# Altium project PCB_Project2.PrjPCB (part 2 of 2)

## Sheet Sheet5.SchDoc
size A2
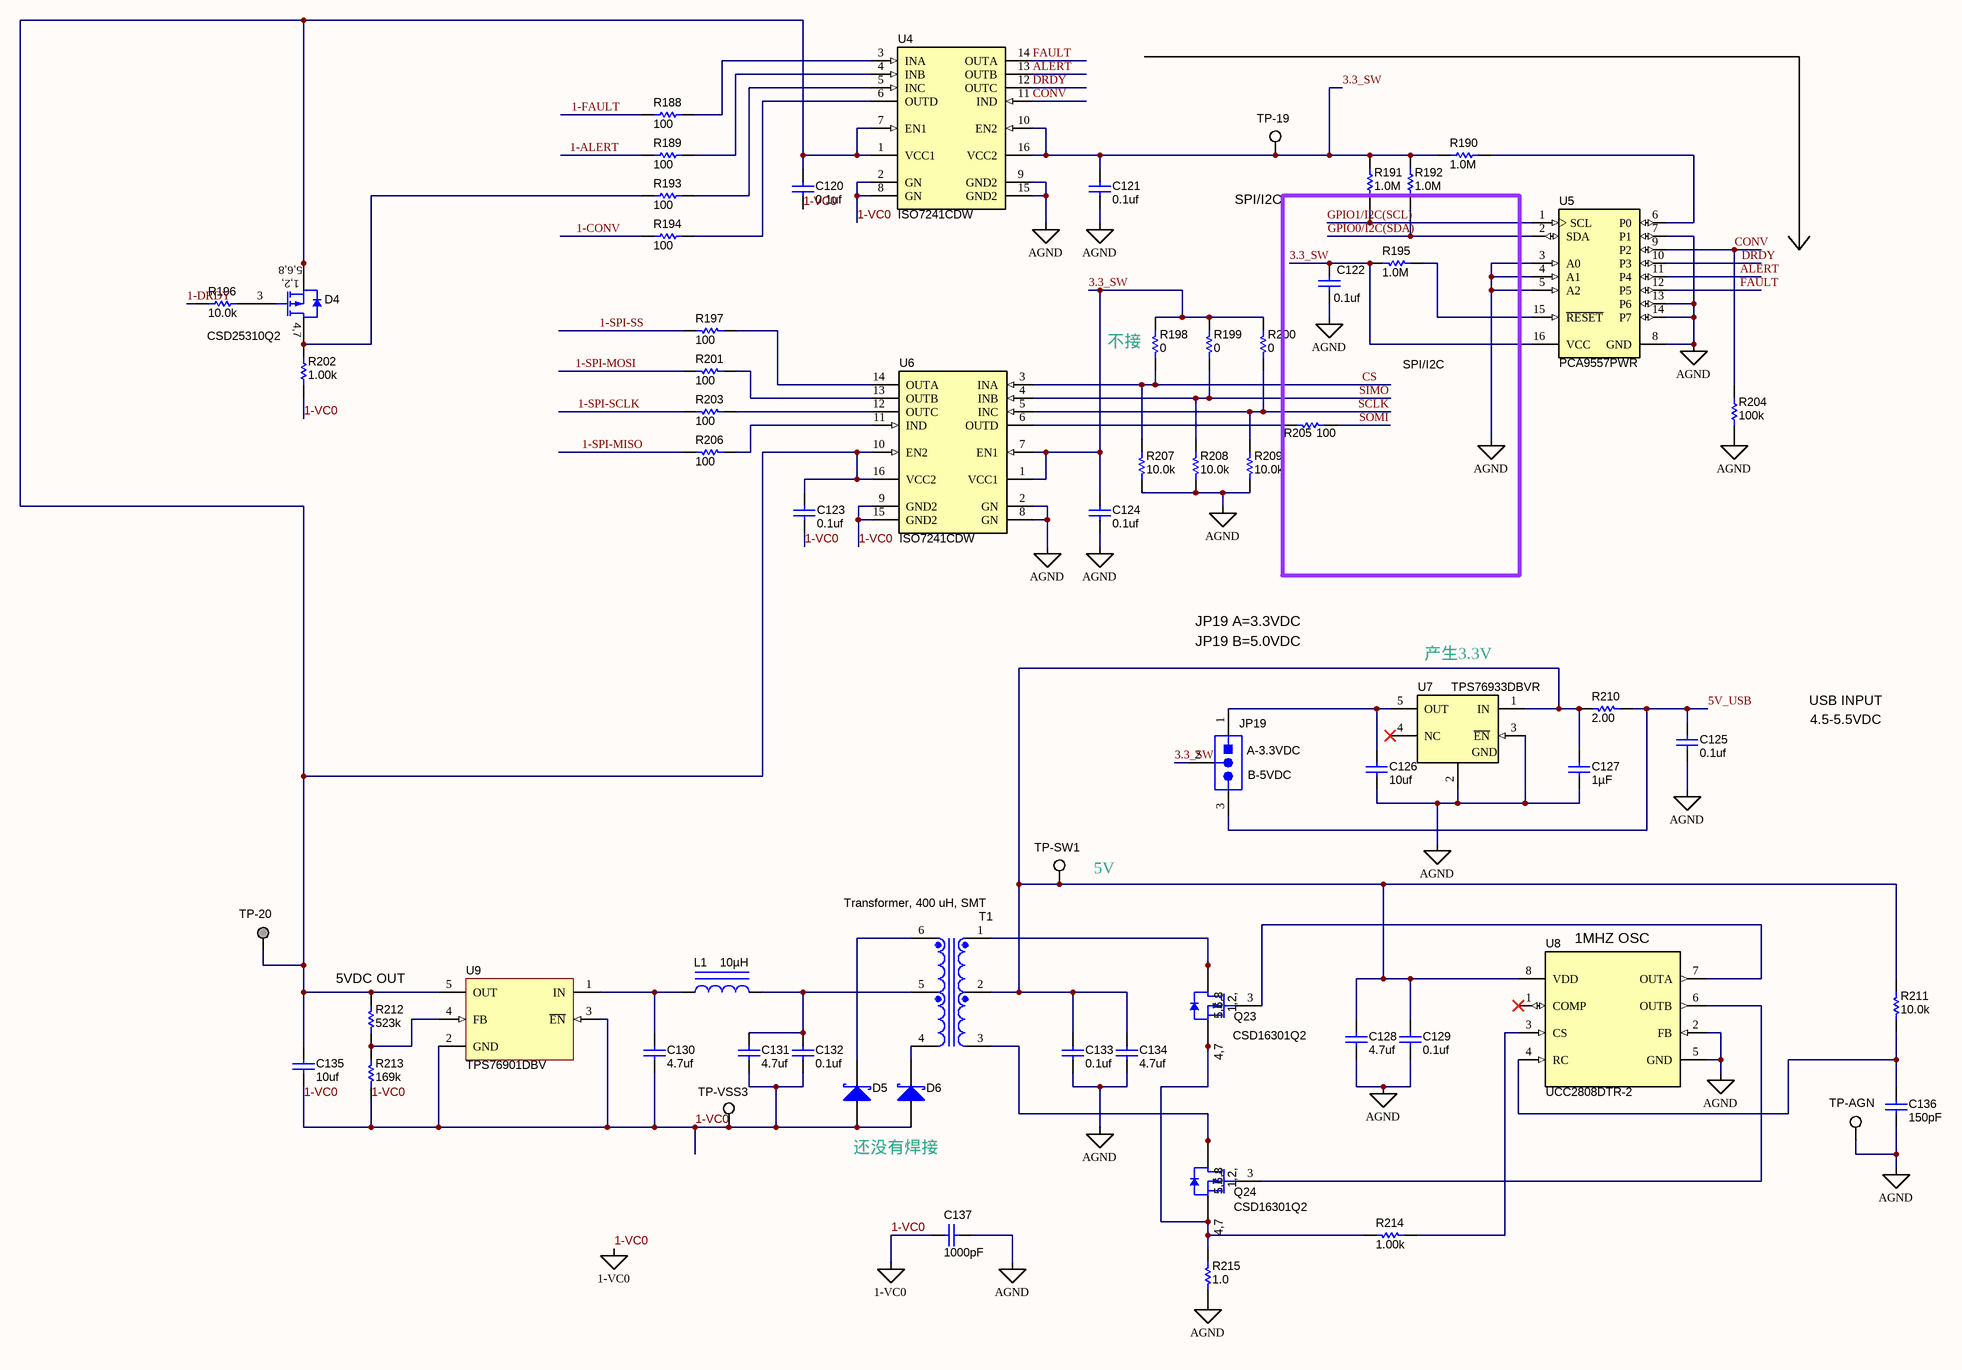
[diagram p2: Sheet5.SchDoc]

### Parts
C120  ValueDisplayed: 0.1uf  [0603]  (hidden comment: 06035C104KAT2A)
C121  ValueDisplayed: 0.1uf  [0603]  (hidden comment: 06035C104KAT2A)
C122  ValueDisplayed: 0.1uf  [0603]  (hidden comment: 06035C104KAT2A)
C123  ValueDisplayed: 0.1uf  [0603]  (hidden comment: 06035C104KAT2A)
C124  ValueDisplayed: 0.1uf  [0603]  (hidden comment: 06035C104KAT2A)
C125  ValueDisplayed: 0.1uf  [0603]  (hidden comment: 06035C104KAT2A)
C126  ValueDisplayed: 10uf  [0805_145]  (hidden comment: C2012X7R1A106M125AC)
C127  ValueDisplayed: 1µF  [0603]  (hidden comment: C1608X7R1C105K)
C128  ValueDisplayed: 4.7uf  [0603]  (hidden comment: C0603C475K8PACTU)
C129  ValueDisplayed: 0.1uf  [0603]  (hidden comment: 06035C104KAT2A)
C130  ValueDisplayed: 4.7uf  [0603]  (hidden comment: C0603C475K8PACTU)
C131  ValueDisplayed: 4.7uf  [0603]  (hidden comment: C0603C475K8PACTU)
C132  ValueDisplayed: 0.1uf  [0603]  (hidden comment: 06035C104KAT2A)
C133  ValueDisplayed: 0.1uf  [0603]  (hidden comment: 06035C104KAT2A)
C134  ValueDisplayed: 4.7uf  [0603]  (hidden comment: C0603C475K8PACTU)
C135  ValueDisplayed: 10uf  [0805_145]  (hidden comment: C2012X7R1A106M125AC)
C136  ValueDisplayed: 150pF  [0603]  (hidden comment: C0603C151J5GACTU)
C137  ValueDisplayed: 1000pF  [CAPRD750W60D700H1000]  (hidden comment: DEBE33F102ZC3B)
D4  CSD25310Q2  [TRANS_NexFET_Q2]
D5  BAT54HT1G  [sod-323]  (value not drawn)
D6  BAT54HT1G  [sod-323]  (value not drawn)
JP19  PEC03SAAN  [CONN_PEC03SAAN]  (value not drawn)
L1  ValueDisplayed: 10µH  [0805_HV]  (hidden comment: LB2012T100KR)
Q23  CSD16301Q2  [TRANS_NexFET_Q2]
Q24  CSD16301Q2  [TRANS_NexFET_Q2]
R188  ValueDisplayed: 100  [0603]  (hidden comment: CRCW0603100RJNEA)
R189  ValueDisplayed: 100  [0603]  (hidden comment: CRCW0603100RJNEA)
R190  ValueDisplayed: 1.0M  [0603]  (hidden comment: CRCW06031M00JNEA)
R191  ValueDisplayed: 1.0M  [0603]  (hidden comment: CRCW06031M00JNEA)
R192  ValueDisplayed: 1.0M  [0603]  (hidden comment: CRCW06031M00JNEA)
R193  ValueDisplayed: 100  [0603]  (hidden comment: CRCW0603100RJNEA)
R194  ValueDisplayed: 100  [0603]  (hidden comment: CRCW0603100RJNEA)
R195  ValueDisplayed: 1.0M  [0603]  (hidden comment: CRCW06031M00JNEA)
R196  ValueDisplayed: 10.0k  [0603]  (hidden comment: ERJ-3EKF1002V)
R197  ValueDisplayed: 100  [0603]  (hidden comment: CRCW0603100RJNEA)
R198  ValueDisplayed: 0  [0603]  (hidden comment: CRCW06030000Z0EA)
R199  ValueDisplayed: 0  [0603]  (hidden comment: CRCW06030000Z0EA)
R200  ValueDisplayed: 0  [0603]  (hidden comment: CRCW06030000Z0EA)
R201  ValueDisplayed: 100  [0603]  (hidden comment: CRCW0603100RJNEA)
R202  ValueDisplayed: 1.00k  [0603]  (hidden comment: RG1608P-102-B-T5)
R203  ValueDisplayed: 100  [0603]  (hidden comment: CRCW0603100RJNEA)
R204  ValueDisplayed: 100k  [0603]  (hidden comment: CRCW0603100KFKEA)
R205  ValueDisplayed: 100  [0603]  (hidden comment: CRCW0603100RJNEA)
R206  ValueDisplayed: 100  [0603]  (hidden comment: CRCW0603100RJNEA)
R207  ValueDisplayed: 10.0k  [0603]  (hidden comment: ERJ-3EKF1002V)
R208  ValueDisplayed: 10.0k  [0603]  (hidden comment: ERJ-3EKF1002V)
R209  ValueDisplayed: 10.0k  [0603]  (hidden comment: ERJ-3EKF1002V)
R210  ValueDisplayed: 2.00  [0603]  (hidden comment: RC0603FR-072RL)
R211  ValueDisplayed: 10.0k  [0603]  (hidden comment: ERJ-3EKF1002V)
R212  ValueDisplayed: 523k  [0603]  (hidden comment: RC0603FR-07523KL)
R213  ValueDisplayed: 169k  [0603]  (hidden comment: RC0603FR-07169KL)
R214  ValueDisplayed: 1.00k  [0603]  (hidden comment: RG1608P-102-B-T5)
R215  ValueDisplayed: 1.0  [0603]  (hidden comment: CRCW06031R00JNEA)
T1  Transformer, 400 uH, SMT  [Coilcraft_Q4470-CL]
TP-19  5015  [Testpoint_Keystone_Miniature]  (value not drawn)
TP-20  5020  [Testpoint_Keystone_Miniature]  (value not drawn)  (no BOM)
TP-AGN  5015  [Testpoint_Keystone_Miniature]  (value not drawn)
TP-SW1  5015  [Testpoint_Keystone_Miniature]  (value not drawn)
TP-VSS3  5015  [Testpoint_Keystone_Miniature]  (value not drawn)
U4  ISO7241CDW  [DW0016A_N]
U5  PCA9557PWR  [PW0016A_N]
U6  ISO7241CDW  [DW0016A_N]
U7  TPS76933DBVR  [DBV0005A_N]
U8  UCC2808DTR-2  [D0008A_N]
U9  TPS76901DBV  [DBV0005A_N]

### Blocks framed on the sheet
SPI/I2C: C122 R195 R205

### Nets
1-VC0: C120.2 C123.2 C130.2 C131.2 C132.2 C135.2 C137.2 D5.2(A) D6.2(A) R202.1 R213.1 TP-VSS3.1 U4.2(GN) U4.8(GN) U6.9(GND2) U6.15(GND2) U9.2(GND) U9.3(~{EN})  [project net 1-CELL0]
AGND: C121.2 C122.2 C124.2 C125.2 C126.2 C127.2 C128.2 C129.2 C133.2 C134.2 C136.2 C137.1 R204.1 R207.1 R208.1 R209.1 R215.1 TP-AGN.1 U4.9(GND2) U4.15(GND2) U5.3(A0) U5.4(A1) U5.5(A2) U5.7(P1) U5.8(GND) U5.13(P6) U5.14(P7) U6.2(GN) U6.8(GN) U7.2(GND) U7.3(~{EN}) U8.2(FB) U8.5(GND)
1-ALERT: R189.1
1-CONV: R194.1
1-DRDY: R196.1
1-FAULT: R188.1
1-SPI-MISO: R206.2
1-SPI-MOSI: R201.2
1-SPI-SCLK: R203.2
1-SPI-SS: R197.2
3.3_SW: C121.1 C122.1 C124.1 JP19.2 R190.2 R191.2 R192.2 R195.2 R198.2 R199.2 R200.2 TP-19.1 U4.10(EN2) U4.16(VCC2) U5.16(VCC) U6.1(VCC1) U6.7(EN1)
5V_USB: C125.1 JP19.3 R210.1
ALERT: U4.13(OUTB) U5.11(P4)
CONV: R204.2 U4.11(IND) U5.9(P2)
CS: R198.1 R207.2 U6.3(INA)
DRDY: U4.12(OUTC) U5.10(P3)
FAULT: U4.14(OUTA) U5.12(P5)
GPIO0/I2C(SDA): R192.1 U5.2(SDA)
GPIO1/I2C(SCL): R191.1 U5.1(SCL)
SCLK: R200.1 R209.2 U6.5(INC)
SIMO: R199.1 R208.2 U6.4(INB)
SOMI: R205.1
NetC120_1: C120.1 C123.1 C135.1 D4.1(S) D4.2(S) D4.5(S) D4.6(S) D4.8(S) R212.1 TP-20.1 U4.1(VCC1) U4.7(EN1) U6.10(EN2) U6.16(VCC2) U9.5(OUT)
NetC126_1: C126.1 JP19.1 U7.5(OUT)
NetC127_1: C127.1 C128.1 C129.1 C133.1 C134.1 R210.2 R211.1 T1.2 TP-SW1.1 U7.1(IN) U8.8(VDD)
NetC130_1: C130.1 L1.2 U9.1(IN)
NetC131_1: C131.1 C132.1 L1.1 T1.5
NetC136_1: C136.1 R211.2 U8.4(RC)
NetD4_3: D4.3(G) R196.2
NetD4_4: D4.4(D) D4.7(D) R193.1 R202.2
NetD5_1: D5.1(K) T1.6
NetD6_1: D6.1(K) T1.4
NetQ23_1: Q23.1(D) Q23.2(D) Q23.5(D) Q23.6(D) Q23.8(D) T1.1
NetQ23_3: Q23.3(G) U8.7(OUTA)
NetQ23_4: Q23.4(S) Q23.7(S) Q24.4(S) Q24.7(S) R214.2 R215.2
NetQ24_1: Q24.1(D) Q24.2(D) Q24.5(D) Q24.6(D) Q24.8(D) T1.3
NetQ24_3: Q24.3(G) U8.6(OUTB)
NetR188_2: R188.2 U4.3(INA)
NetR189_2: R189.2 U4.4(INB)
NetR190_1: R190.1 U5.6(P0)
NetR193_2: R193.2 U4.5(INC)
NetR194_2: R194.2 U4.6(OUTD)
NetR195_1: R195.1 U5.15(~{RESET})
NetR197_1: R197.1 U6.14(OUTA)
NetR201_1: R201.1 U6.13(OUTB)
NetR203_1: R203.1 U6.12(OUTC)
NetR205_2: R205.2 U6.6(OUTD)
NetR206_1: R206.1 U6.11(IND)
NetR212_2: R212.2 R213.2 U9.4(FB)
NetR214_1: R214.1 U8.3(CS)

Not connected (* = marked no-connect by the designer): U7 4(NC)*; U8 1(COMP)*

### Notes on the sheet
- (near TP-19) SPI/I2C
- (near R198) 不接
- JP19 A=3.3VDC
- JP19 B=5.0VDC
- (near U7) 产生3.3V
- USB INPUT
- (near JP19) B-5VDC
- (near JP19) A-3.3VDC
- 4.5-5.5VDC
- (near TP-SW1) 5V
- (near R212) 5VDC OUT
- (near U8) 1MHZ OSC
- 还没有焊接
- (in symbol CSD16301Q2) 5,6,8; 1,2,; 4,7
- (in symbol CSD25310Q2) 5,6,8; 1,2,; 4,7

### Library data of the parts
C120-C125 C129 C132 C133 = 06035C104KAT2A: CAP, CERM, 0.1uf, 50 V, +/- 10%, X7R, 0603; Manufacturer: AVX; Polarized: N; CompType: Capacitor; U/M: EA; Cap_F: 0.0000001; Tolerance_%: 10; Value1: Unknown; VDC_V: 50; Value2: 50V; TaMin_C: -55; TaMax_C: 125; SymbolVersion: 2008-07-09; Value: 0.1uF; PartNumber: 06035C104KAT2A; PackageReference: 0603; RoHS: Y; MountType: SMT; Technology: Ceramic; TempCo: X7R; Cap_Case: 0603; Published: 2008-06-19; Publisher: Texas Instruments; LatestRevisionDate: 2015-07-09; ComponentLink1Description: Datasheet link; ComponentLink1URL: http://www.avx.com/docs/Catalogs/cx7r.pdf; Supplier 1: Digi-Key; Supplier Part Number 1: 478-5052-1-ND; Supplier 2: Mouser; Supplier Part Number 2: 581-06035C104KAT2A; Supplier 3: Farnell; Supplier Part Number 3: 1301804
C126 C135 = C2012X7R1A106M125AC: CAP, CERM, 10uf, 10 V, +/- 20%, X7R, 0805; Manufacturer: TDK; Polarized: N; CompType: Capacitor; U/M: EA; Cap_F: 0.00001; Tolerance_%: 20; Value1: Unknown; VDC_V: 10; Value2: 10V; TaMin_C: -55; TaMax_C: 125; Cap_Case: 0805; SymbolVersion: 2008-07-09; Value: 10uF; PartNumber: C2012X7R1A106M125AC; PackageReference: 0805; RoHS: Y; MountType: SMT; Technology: Ceramic; TempCo: X7R; Published: 2008-06-19; Publisher: Texas Instruments; LatestRevisionDate: 2015-07-09; ComponentLink1Description: Datasheet link; ComponentLink1URL: http://product.tdk.com/capacitor/mlcc/en/documents/mlcc_commercial_general_en.pdf; Supplier 1: Digi-Key; Supplier Part Number 1: 445-7592-1-ND; Supplier 2: Mouser; Supplier Part Number 2: 810-C2012X7R1A106M; Supplier 3: Farnell; Supplier Part Number 3: 2354122
C127 = C1608X7R1C105K: CAP, CERM, 1 µF, 16 V, +/- 10%, X7R, 0603; Manufacturer: TDK; Polarized: N; CompType: Capacitor; Value: 1uF; U/M: EA; Cap_F: 0.000001; Tolerance_%: 10; ESR_ohm: 0.0057; Value1: 0.0057 ohm; VDC_V: 16; Value2: 16V; TaMin_C: -55; TaMax_C: 125; SymbolVersion: 2008-07-09; PartNumber: C1608X7R1C105K; PackageReference: 0603; RoHS: Y; MountType: SMT; Technology: Ceramic; TempCo: X7R; Cap_Case: 0603; Published: 2008-06-19; Publisher: Texas Instruments; LatestRevisionDate: 2015-07-09; ComponentLink1Description: Datasheet link; ComponentLink1URL: http://www.tdk.co.jp/tefe02/e412_c.pdf; Supplier 1: Digi-Key; Supplier Part Number 1: 445-1604-1-ND; Supplier 2: Farnell; Supplier Part Number 2: 1907343
C128 C130 C131 C134 = C0603C475K8PACTU: CAP, CERM, 4.7uf, 10 V, +/- 10%, X5R, 0603; Manufacturer: Kemet; Polarized: N; CompType: Capacitor; U/M: EA; Cap_F: 0.0000047; Tolerance_%: 10; ESR_ohm: 0.006; Value1: 0.006 ohm; Value2: 10V; IRMS_A: 7.24; TaMin_C: -55; TaMax_C: 85; SymbolVersion: 2008-07-09; Value: 4.7uF; PartNumber: C0603C475K8PACTU; PackageReference: 0603; RoHS: Y; VDC_V: 10; MountType: SMT; Technology: Ceramic; TempCo: X5R; Cap_Case: 0603; Published: 2008-06-19; Publisher: Texas Instruments; LatestRevisionDate: 2015-07-09; ComponentLink1Description: Datasheet link; ComponentLink1URL: http://www.kemet.com/kemet/web/homepage/kechome.nsf/vapubfiles/F3102_Y5V.pdf/$file/F3102_Y5V.pdf; Supplier 1: Digi-Key; Supplier Part Number 1: 399-5503-1-ND; Supplier 2: Mouser; Supplier Part Number 2: 80-C0603C475K8P; Supplier 3: Farnell; Supplier Part Number 3: 1572625
C136 = C0603C151J5GACTU: CAP, CERM, 150 pF, 50 V, +/- 5%, C0G/NP0, 0603; Manufacturer: Kemet; Polarized: N; CompType: Capacitor; Value: 150pF; U/M: EA; Cap_F: 0.00000000015; Tolerance_%: 5; Value1: Unknown; VDC_V: 50; Value2: 50V; TaMin_C: -55; TaMax_C: 125; SymbolVersion: 2008-07-09; PartNumber: C0603C151J5GACTU; PackageReference: 0603; RoHS: Y; MountType: SMT; Technology: Ceramic; TempCo: C0G/NP0; Cap_Case: 0603; Published: 2008-06-19; Publisher: Texas Instruments; LatestRevisionDate: 2015-07-09; ComponentLink1Description: Datasheet link; ComponentLink1URL: http://www.kemet.com/kemet/web/homepage/kechome.nsf/vapubfiles/F3102_Y5V.pdf/$file/F3102_Y5V.pdf; Supplier 1: Digi-Key; Supplier Part Number 1: 399-1063-1-ND; Supplier 2: Mouser; Supplier Part Number 2: 80-C0603C151J5G; Supplier 3: Farnell; Supplier Part Number 3: 1414615
C137 = DEBE33F102ZC3B: CAP, CERM, 1000 pF, 3150 V, +80/-20%, E, Radial Disc D7x6mm; Manufacturer: MuRata; Polarized: N; CompType: Capacitor; Value: 1000pF; U/M: EA; Cap_F: 0.000000001; Tolerance_%: 80; Value1: Unknown; VDC_V: 3150; Value2: 3150V; TaMin_C: -25; TaMax_C: 85; Cap_Case: Disc, 7x6mm; SymbolVersion: 2008-07-09; PartNumber: DEBE33F102ZC3B; PackageReference: Radial Disc D7x6mm; RoHS: Y; MountType: TH; Technology: Ceramic; TempCo: E; Published: 2008-06-19; Publisher: Texas Instruments; LatestRevisionDate: 2015-07-09; ComponentLink1Description: Datasheet link; ComponentLink1URL: http://www.murata.com/products/catalog/pdf/c85e.pdf; Supplier 1: Digi-Key; Supplier Part Number 1: 490-4247-ND; Supplier 2: Mouser; Supplier Part Number 2: 81-DEBE33F102ZC3B; Supplier 3: Farnell; Supplier Part Number 3: 9527192
D4 = CSD25310Q2: MOSFET, P-CH, -20 V, -20 A, SON 2x2mm; Manufacturer: Texas Instruments; Alternate Manufacturer: None; SymbolCreator: a0411947; U/M: EA; ChType: P; Value: -20V; Value1: 0.0239 ohm; Rdson45_ohm: 0.0239; Value2: 3.6 nC; QgTyp_nC: 3.6; Vgs_V: 8; AEC Category: Q101; SymbolVersion: 2013-04-04; PartNumber: CSD25310Q2; PackageReference: SON 2x2mm; CompType: MOSFET; VdsMax_V: -20; IdsMax_A: -20; RoHS: Y; MountType: SMT; Published: 2008-06-19; Publisher: Texas Instruments; LatestRevisionDate: 2015-08-18; LatestRevisionNote: Added parts.; ComponentLink1Description: Datasheet link; ComponentLink1URL: http://www.ti.com/lit/ds/symlink/csd25310q2.pdf; Supplier 1: Digi-Key; Supplier Part Number 1: CSD25310Q2-ND; Supplier 2: Mouser; Supplier Part Number 2: 595-CSD25310Q2; AEC Qualified: ?
D5 D6 = BAT54HT1G: Diode, Schottky, 30 V, 0.2 A, SOD-323; Manufacturer: ON Semiconductor; U/M: EA; Vf_V: 0.35; Value: 30V; Value1: 0.2A; Value2: 0.35V; Io_A: 0.2; Vr_V: 30; CompType: Diode; SymbolVersion: 2008-12-08; PartNumber: BAT54HT1G; PackageReference: SOD-323; MountType: SMT; Type: Schottky; Published: 2008-06-26; Publisher: Texas Instruments; LatestRevisionDate: 2015-07-08; ComponentLink1Description: Datasheet link; ComponentLink1URL: http://www.onsemi.com/pub/Collateral/BAT54HT1-D.PDF; Supplier 1: Digi-Key; Supplier Part Number 1: BAT54HT1OSCT-ND; Supplier 2: Mouser; Supplier Part Number 2: 863-BAT54HT1G; Supplier 3: Farnell; Supplier Part Number 3: 1459033
JP19 = PEC03SAAN: Header, 100mil, 3x1, Tin, TH; Manufacturer: Sullins Connector Solutions; SymbolCreator: a0799628; U/M: EA; SymbolVersion: 2013-03-28; PartNumber: PEC03SAAN; PackageReference: Header, 3 PIN, 100mil, Tin; ClassName: Header; CompType: Header; RoHS: Y; MountType: TH; ComponentLink1Description: Datasheet Link; ComponentLink1URL: http://www.sullinscorp.com/catalogs/97_Page78-79_HEADER_.100_2.54mm_MALE_BREAKAWAY.pdf; Publisher: Texas Instruments; LatestRevisionDate: 2015-07-02; Supplier 1: Digi-Key; Supplier Part Number 1: S1012E-03-ND
L1 = LB2012T100KR: Inductor, Wirewound, Ferrite, 10uH, 0.12A, 0.5 ohm, SMD; Manufacturer: Taiyo Yuden; Ind_H: 10.0E-6; Imax_A: 0.12; Irms: 0.12A @ C rise; Isat: 0.12A @ % inductance drop; DCR_ohm: 0.5; Value1: 0.5 ohm; U/M: EA; SymbolVersion: 2008-07-23; CompType: Inductor; Value: 10uH; PartNumber: LB2012T100KR; PackageReference: 0805; Value2: 0.12A; Technology: Wirewound; MountType: SMT; Material: Ferrite; Published: 2008-06-26; Publisher: Texas Instruments; LatestRevisionDate: 2013-10-24; ComponentLink1Description: Datasheet link; ComponentLink1URL: http://www.yuden.co.jp/ut/product/category/inductor/LB2012T100KR.pdf; RoHS: Y; Supplier 1: Digi-Key; Supplier Part Number 1: 587-2487-1-ND; Supplier 2: Mouser; Supplier Part Number 2: 963-LB2012T100KR; Supplier 3: Farnell; Supplier Part Number 3: 1463501
Q23 Q24 = CSD16301Q2: MOSFET, N-CH, 25 V, 5 A, SON 2x2mm; Manufacturer: Texas Instruments; Alternate Manufacturer: None; U/M: EA; ChType: N; Value: 25V; VdsMax_V: 25; Value1: 0.023 ohm; Rdson45_ohm: 0.023; Value2: 2 nC; QgTyp_nC: 2; Vgs_V: 10; IdsMax_A: 5; SymbolVersion: 2011-11-14; CompType: MOSFET; PartNumber: CSD16301Q2; PackageReference: SON 2x2mm; RoHS: Y; MountType: SMT; Published: 2008-06-19; Publisher: Texas Instruments; LatestRevisionDate: 2015-08-03; LatestRevisionNote: Added parts.; ComponentLink1Description: Datasheet link; ComponentLink1URL: http://www.ti.com/lit/ds/symlink/csd16301q2.pdf; Supplier 1: Digi-Key; Supplier Part Number 1: 296-25260-1-ND; Supplier 2: Mouser; Supplier Part Number 2: 595-CSD16301Q2; Supplier 3: Farnell; Supplier Part Number 3: 1854243
R188 R189 R193 R194 R197 R201 R203 R205 R206 = CRCW0603100RJNEA: RES, 100, 5%, 0.1 W, 0603; Manufacturer: Vishay-Dale; CompType: Resistor; Value: 100; Value_Code: 100R; Tolerance_%: 5; Power_W: 0.1; Value2: 0.1W; VDC_V: 75; TempCo: 200 ppm/C; EIA_Code: E24; U/M: EA; SymbolVersion: 2009-05-29; PartNumber: CRCW0603100RJNEA; PackageReference: 0603; RoHS: Y; Res_ohm: 100; Value1: 5%; MountType: SMT; Technology: Thick Film; Published: 2008-06-26; Publisher: Texas Instruments; LatestRevisionDate: 2015-06-13; ComponentLink1Description: Datasheet link; ComponentLink1URL: http://www.vishay.com/docs/20035/dcrcwe3.pdf; Supplier 1: Digi-Key; Supplier Part Number 1: 541-100GCT-ND; Supplier 2: Mouser; Supplier Part Number 2: 71-CRCW0603J-100-E3; Supplier 3: Farnell; Supplier Part Number 3: 1514715
R190-R192 R195 = CRCW06031M00JNEA: RES, 1.0 M, 5%, 0.1 W, 0603; Manufacturer: Vishay-Dale; CompType: Resistor; Value: 1.0Meg; Res_ohm: 1000000; Value_Code: 1M00; Tolerance_%: 5; Power_W: 0.1; Value2: 0.1W; VDC_V: 75; TempCo: 200 ppm/C; EIA_Code: E24; U/M: EA; SymbolVersion: 2009-05-29; PartNumber: CRCW06031M00JNEA; PackageReference: 0603; RoHS: Y; Value1: 5%; MountType: SMT; Technology: Thick Film; Published: 2008-06-26; Publisher: Texas Instruments; LatestRevisionDate: 2015-06-13; ComponentLink1Description: Datasheet link; ComponentLink1URL: http://www.vishay.com/docs/20035/dcrcwe3.pdf; Supplier 1: Digi-Key; Supplier Part Number 1: 541-1.0MGCT-ND; Supplier 2: Mouser; Supplier Part Number 2: 71-CRCW0603J-1.0M-E3; Supplier 3: Farnell; Supplier Part Number 3: 1514706
R196 R207-R209 R211 = ERJ-3EKF1002V: RES, 10.0 k, 1%, 0.1 W, 0603; Manufacturer: Panasonic; CompType: Resistor; Value: 10.0k; Res_ohm: 10000; Value_Code: 10k0; Tolerance_%: 1; Power_W: 0.1; Value2: 0.1W; VDC_V: 75; TempCo: 100 ppm/C; EIA_Code: E96; U/M: EA; SymbolVersion: 2009-05-29; PartNumber: ERJ-3EKF1002V; PackageReference: 0603; RoHS: Y; Value1: 1%; MountType: SMT; Technology: Thick Film; Published: 2008-06-26; Publisher: Texas Instruments; LatestRevisionDate: 2015-06-13; ComponentLink1Description: Datasheet link; ComponentLink1URL: http://industrial.panasonic.com/www-data/pdf/AOA0000/AOA0000CE2.pdf; Supplier 1: Digi-Key; Supplier Part Number 1: P10.0KHCT-ND; Supplier 2: Mouser; Supplier Part Number 2: 667-ERJ-3EKF1002V; Supplier 3: Farnell; Supplier Part Number 3: 2397737
R198-R200 = CRCW06030000Z0EA: RES, 0, 5%, 0.1 W, 0603; Manufacturer: Vishay-Dale; CompType: Resistor; Value: 0; Value_Code: 0000; Tolerance_%: 5; Power_W: 0.1; Value2: 0.1W; VDC_V: 75; TempCo: 200 ppm/C; EIA_Code: E24; U/M: EA; SymbolVersion: 2009-05-29; PartNumber: CRCW06030000Z0EA; PackageReference: 0603; RoHS: Y; Res_ohm: 0; Value1: 5%; MountType: SMT; Technology: Thick Film; Published: 2008-06-26; Publisher: Texas Instruments; LatestRevisionDate: 2015-06-13; ComponentLink1Description: Datasheet link; ComponentLink1URL: http://www.vishay.com/docs/20035/dcrcwe3.pdf; Supplier 1: Digi-Key; Supplier Part Number 1: 541-0.0GCT-ND; Supplier 2: Mouser; Supplier Part Number 2: 71-CRCW0603-0-E3; Supplier 3: Farnell; Supplier Part Number 3: 1469739
R202 R214 = RG1608P-102-B-T5: RES, 1.00 k, 0.1%, 0.1 W, 0603; Manufacturer: Susumu Co Ltd; CompType: Resistor; Value: 1.00k; Res_ohm: 1000; Value_Code: 1k00; Tolerance_%: 0.1; Value2: 0.1W; VDC_V: 75; TempCo: 25 ppm/C; EIA_Code: E192; U/M: EA; SymbolVersion: 2009-05-29; PartNumber: RG1608P-102-B-T5; PackageReference: 0603; RoHS: Y; Value1: 0.1%; Power_W: 0.1; MountType: SMT; Technology: Metal Film; Published: 2008-06-26; Publisher: Texas Instruments; LatestRevisionDate: 2015-06-13; ComponentLink1Description: Datasheet link; ComponentLink1URL: http://www.susumu.co.jp/english/pdf/products-j01-01.pdf; Supplier 1: Digi-Key; Supplier Part Number 1: RG16P1.0KBCT-ND; Supplier 2: Mouser; Supplier Part Number 2: 754-RG1608P-102-B-T5; Supplier 3: Farnell; Supplier Part Number 3: 1797076
R204 = CRCW0603100KFKEA: RES, 100 k, 1%, 0.1 W, 0603; Manufacturer: Vishay-Dale; CompType: Resistor; Value: 100k; Res_ohm: 100000; Tolerance_%: 1; Power_W: 0.1; Value2: 0.1W; VDC_V: 75; TempCo: 100 ppm/C; EIA_Code: E96; U/M: EA; SymbolVersion: 2009-05-29; PartNumber: CRCW0603100KFKEA; PackageReference: 0603; RoHS: Y; Value_Code: 100k; Value1: 1%; MountType: SMT; Technology: Thick Film; Published: 2008-06-26; Publisher: Texas Instruments; LatestRevisionDate: 2015-06-13; ComponentLink1Description: Datasheet link; ComponentLink1URL: http://www.vishay.com/docs/20035/dcrcwe3.pdf; Supplier 1: Digi-Key; Supplier Part Number 1: 541-100KHCT-ND; Supplier 2: Mouser; Supplier Part Number 2: 71-CRCW0603-100K-E3; Supplier 3: Farnell; Supplier Part Number 3: 1469649
R210 = RC0603FR-072RL: RES, 2.00, 1%, 0.1 W, 0603; Manufacturer: Yageo America; CompType: Resistor; Value: 2.00; Res_ohm: 2; Value_Code: 2R00; Tolerance_%: 1; Power_W: 0.1; Value2: 0.1W; VDC_V: 150; TempCo: 200 ppm/C; EIA_Code: E96; U/M: EA; SymbolVersion: 2009-05-29; PartNumber: RC0603FR-072RL; PackageReference: 0603; RoHS: Y; Value1: 1%; MountType: SMT; Technology: Thick Film; Published: 2008-06-26; Publisher: Texas Instruments; LatestRevisionDate: 2015-06-13; ComponentLink1Description: Datasheet link; ComponentLink1URL: http://www.yageo.com/pdf/Pu-RC0603_51_PbFree_L_2.pdf; Supplier 1: Digi-Key; Supplier Part Number 1: 311-2.00HRCT-ND; Supplier 2: Mouser; Supplier Part Number 2: 603-RC0603FR-072RL; Supplier 3: Farnell; Supplier Part Number 3: 1872498
R212 = RC0603FR-07523KL: RES, 523 k, 1%, 0.1 W, 0603; Manufacturer: Yageo America; CompType: Resistor; Value: 523k; Res_ohm: 523000; Tolerance_%: 1; Power_W: 0.1; Value2: 0.1W; VDC_V: 150; TempCo: 200 ppm/C; EIA_Code: E96; U/M: EA; SymbolVersion: 2009-05-29; PartNumber: RC0603FR-07523KL; PackageReference: 0603; RoHS: Y; Value_Code: 523k; Value1: 1%; MountType: SMT; Technology: Thick Film; Published: 2008-06-26; Publisher: Texas Instruments; LatestRevisionDate: 2015-06-13; ComponentLink1Description: Datasheet link; ComponentLink1URL: http://www.yageo.com/pdf/Pu-RC0603_51_PbFree_L_2.pdf; Supplier 1: Digi-Key; Supplier Part Number 1: 311-523KHRCT-ND; Supplier 2: Mouser; Supplier Part Number 2: 603-RC0603FR-07523KL
R213 = RC0603FR-07169KL: RES, 169 k, 1%, 0.1 W, 0603; Manufacturer: Yageo America; CompType: Resistor; Value: 169k; Res_ohm: 169000; Tolerance_%: 1; Power_W: 0.1; Value2: 0.1W; VDC_V: 150; TempCo: 200 ppm/C; EIA_Code: E96; U/M: EA; SymbolVersion: 2009-05-29; PartNumber: RC0603FR-07169KL; PackageReference: 0603; RoHS: Y; Value_Code: 169k; Value1: 1%; MountType: SMT; Technology: Thick Film; Published: 2008-06-26; Publisher: Texas Instruments; LatestRevisionDate: 2015-06-13; ComponentLink1Description: Datasheet link; ComponentLink1URL: http://www.yageo.com/pdf/Pu-RC0603_51_PbFree_L_2.pdf; Supplier 1: Digi-Key; Supplier Part Number 1: 311-169KHRCT-ND; Supplier 2: Mouser; Supplier Part Number 2: 603-RC0603FR-07169KL
R215 = CRCW06031R00JNEA: RES, 1.0, 5%, 0.1 W, 0603; Manufacturer: Vishay-Dale; CompType: Resistor; Value: 1.0; Res_ohm: 1; Value_Code: 1R00; Tolerance_%: 5; Power_W: 0.1; Value2: 0.1W; VDC_V: 75; TempCo: 200 ppm/C; EIA_Code: E24; U/M: EA; SymbolVersion: 2009-05-29; PartNumber: CRCW06031R00JNEA; PackageReference: 0603; RoHS: Y; Value1: 5%; MountType: SMT; Technology: Thick Film; Published: 2008-06-26; Publisher: Texas Instruments; LatestRevisionDate: 2015-06-13; ComponentLink1Description: Datasheet link; ComponentLink1URL: http://www.vishay.com/docs/20035/dcrcwe3.pdf; Supplier 1: Digi-Key; Supplier Part Number 1: 541-1.0GCT-ND; Supplier 2: Mouser; Supplier Part Number 2: 71-CRCW0603J-1-E3; Supplier 3: Farnell; Supplier Part Number 3: 1514709
T1 = Q4470-CLB: Manufacturer: Coilcraft; SymbolCreator: Altium; DCR_Ohm: 0.95; Value: 400 uH; U/M: EA; SymbolVersion: 2015-08-10; PartNumber: Q4470-CLB; CompType: Transformer; PackageReference: 6.6x6.99mm; MountType: SMT; RoHS: Y; ComponentLink1Description: Datasheet Link; ComponentLink1URL: http://www.coilcraft.com/pdfs/mintrans.pdf; Publisher: Texas Instruments; LatestRevisionDate: 2015-08-11
TP-19 TP-AGN TP-SW1 TP-VSS3 = 5015: Test Point, Miniature, SMT; Manufacturer: Keystone; CompType: Test Point Loop; U/M: EA; SymbolVersion: 2008-07-10; PackageReference: Testpoint_Keystone_Miniature; Publisher: Texas Instruments; LatestRevisionDate: 2015-07-28; PartNumber: 5015; RoHS: Y; MountType: SMT; ComponentLink1Description: Datasheet Link; ComponentLink1URL: http://www.keyelco.com/userAssets/store/files/5015.PDF; Value: SMT; Supplier 1: Digi-Key; Supplier Part Number 1: 36-5015CT-ND
TP-20 = 5020: LOW PROFILE, TH; Manufacturer: Keystone; CompType: Standoff; SymbolVersion: 2010-10-20; PackageReference: LOW PROFILE, TH; Publisher: Texas Instruments; LatestRevisionDate: 2015-08-11; PartNumber: 5020; RoHS: Y; MountType: TH; ComponentLink1Description: Datasheet Link; ComponentLink1URL: http://keyelco.com/userAssets/file/M65p56.pdf; Supplier 1: Digi-Key; Supplier Part Number 1: 36-5020-ND; Supplier 2: Mouser; Supplier Part Number 2: 534-5020; Supplier 3: Farnell; Supplier Part Number 3: 1702264
U4 U6 = ISO7241CDW: 25 Mbps Quad Channels, 3 / 1, Digital Isolator, 3.3 V / 5 V, -40 to +125 degC, 16-pin SOIC (DW), Green (RoHS & no Sb/Br); Manufacturer: Texas Instruments; Alternate PartNumber: Equivalent; Datarate(Mbps): 25; Input Noise Filter: Yes; Insulation Rating(VRMS): 2500; Prop Delay(Max)(ns): 42; Rating: Catalog; Supply Voltage(s)(V): 3.3, 5; TTL/CMOS Input Threshold: TTL; DatasheetVersion: SLLS868N; PackageVersion: 4040000-2/G, 01/2011; PackageReference: DW0016A; PackageDescription: 16-Pin Plastic Small Outline, Body 10.30 x 7.50 mm, Pitch 1.27 mm; Supplier 1: Digi-Key; Supplier Part Number 1: 296-22963-5-ND; Supplier 2: Farnell; Supplier Part Number 2: 2296075; Supplier 3: Newark; Supplier Part Number 3: 73M3155; Supplier 4: Mouser; Supplier Part Number 4: 595-ISO7241CDW; SubFamily: Isolator; Thermal Shutdown: No; MountType: SMT; Code_JEDEC: MS-013; PartNumber: ISO7241CDW; ComponentLink1Description: Manufacturer URL; ComponentLink1URL: http://www.ti.com/; ComponentLink2Description: Datasheet; ComponentLink2URL: http://www.ti.com/general/docs/lit/getliterature.tsp?genericPartNumber=ISO7241C&fileType=pdf; ComponentLink3Description: Package Specification; ComponentLink3URL: http://www.ti.com/litv/pdf/msoi003g; ComponentLink4Description: SamplesURL; ComponentLink4URL: http://www.ti.com/product/iso7241c#samples; Alternate Manufacturer: Texas Instruments
U5 = PCA9557PWR: Remote 8-Bit I2C and SMBus Low-Power I/O Expander with Reset and Configuration Registers, 2.3 to 5.5 V, -40 to 85 degC, 16-pin TSSOP (PW), Green (RoHS & no Sb/Br); Manufacturer: Texas Instruments; Alternate PartNumber: Equivalent; SubFamily: I2C IO Expander; No. of Outputs: 8; Reset Input: Yes; fSCLK(Max)(MHz): 400; VCC(Min)(V): 2.3; VCC(Max)(V): 5.5; I2C Address: 0011 xxx; DatasheetVersion: SCPS133I; PackageVersion: revG, Feb-2011; PackageReference: PW0016A; PackageDescription: 16-Pin Plastic Thin Small Outline Package 5 x 4.4 mm Body ,0.65 mm Pitch; Supplier 1: Digi-Key; Supplier Part Number 1: 296-20978-2-ND; Supplier 2: Digi-Key; Supplier Part Number 2: 296-20978-1-ND; Supplier 3: Digi-Key; Supplier Part Number 3: 296-20978-6-ND; Supplier 4: Newark; Supplier Part Number 4: 80K2703; Supplier 5: Mouser; Supplier Part Number 5: 595-PCA9557PWR; Eco-Plan: Green (RoHS & no Sb/Br); Technology Family: I2C; Max Frequency(kHz): 400; # of I/Os: 8; Vcc range(V): 2.3 to 5.5; Low Power: Yes; Configuration Registers: Yes; 5V Tolerant I/O: Yes; Push-Pull I/O Type: Yes; Open Drain I/O Type: Yes; MountType: SMT; PartNumber: PCA9557PWR; Code_JEDEC: MO-153; ComponentLink1Description: Datasheet; ComponentLink1URL: http://www.ti.com/general/docs/lit/getliterature.tsp?genericPartNumber=PCA9557&fileType=pdf; ComponentLink2Description: URL Link1; ComponentLink2URL: SamplesURL:http://www.ti.com/product/pca9557#samples; Alternate Manufacturer: Texas Instruments
U7 = TPS76933DBVR: Single Output LDO, 100 mA, Fixed 3.3 V Output, 2.7 to 10 V Input, with Low IQ, 5-pin SOT-23 (DBV), -40 to 125 degC, Green (RoHS & no Sb/Br); Manufacturer: Texas Instruments; Alternate PartNumber: Equivalent; Accuracy(%): 3; Fixed Output Options(V): 3.3; Iout(Max)(A): 0.1; Iq(Typ)(mA): 0.02; Rating: Catalog; SubFamily: Single Channel LDO; Vdo(Typ)(mV): 98; Vin(Max)(V): 10; Vin(Min)(V): 2.7; DatasheetVersion: SLVS203E; PackageVersion: 4073253-4/K; PackageReference: DBV0005A; PackageDescription: 5-Pin Plastic Small Outline, Body 1.60 × 2.90 mm, Pitch 0.95 mm; Supplier 1: Digi-Key; Supplier Part Number 1: 296-11039-2-ND; Supplier 2: Digi-Key; Supplier Part Number 2: 296-11039-1-ND; Supplier 3: Digi-Key; Supplier Part Number 3: 296-11039-6-ND; Supplier 4: Farnell; Supplier Part Number 4: 1535764; Supplier 5: Newark; Supplier Part Number 5: 77C1164; Supplier 6: Mouser; Supplier Part Number 6: 595-TPS76933DBVR; Eco-Plan: Green (RoHS & no Sb/Br); Vout Adj(Max)(V): 3.3; Vout Adj(Min)(V): 3.3; MountType: SMT; Code_JEDEC: MO-178; PartNumber: TPS76933DBVR; ComponentLink1Description: Manufacturer URL; ComponentLink1URL: http://www.ti.com/; ComponentLink2Description: Datasheet; ComponentLink2URL: http://www.ti.com/general/docs/lit/getliterature.tsp?genericPartNumber=TPS76933&fileType=pdf; ComponentLink3Description: Package Specification; ComponentLink3URL: http://www.ti.com/litv/pdf/mpds018i; ComponentLink4Description: URL Link1; ComponentLink4URL: Samples URL:http://www.ti.com/product/tps76933#samples; Alternate Manufacturer: Texas Instruments
U8 = UCC2808DTR-2: LOW POWER CURRENT MODE PUSH-PULL PWM, D0008A; Alternate PartNumber: UCC2808D-2; Manufacturer: Texas Instruments; SymbolCreator: Altium; CompType: IC; U/M: EA; SymbolVersion: 2015-08-18; PartNumber: UCC2808DTR-2; PackageReference: D0008A; MountType: SMT; ComponentLink1Description: Datasheet Link; ComponentLink1URL: http://www.ti.com/lit/ds/symlink/ucc2808-2.pdf; RoHS: Y; Publisher: Texas Instruments; LatestRevisionDate: 2015-08-19; Alternate Manufacturer: Texas Instruments
U9 = TPS76901DBV: Ultralow-Power 100-mA Low-Dropout Linear Regulators, DBV0005A; Manufacturer: Texas Instruments; SymbolCreator: a0411947; CompType: IC; U/M: EA; SymbolVersion: 2013-10-18; PartNumber: TPS76901DBV; PackageReference: DBV0005A; MountType: SMT; ComponentLink1Description: Datasheet Link; ComponentLink1URL: http://www.ti.com/lit/ds/symlink/tps76901.pdf; RoHS: Y; Publisher: Texas Instruments; LatestRevisionDate: 2015-07-05; Alternate Manufacturer: Texas Instruments

## Sheet Sheet_hardware.SchDoc
size A4
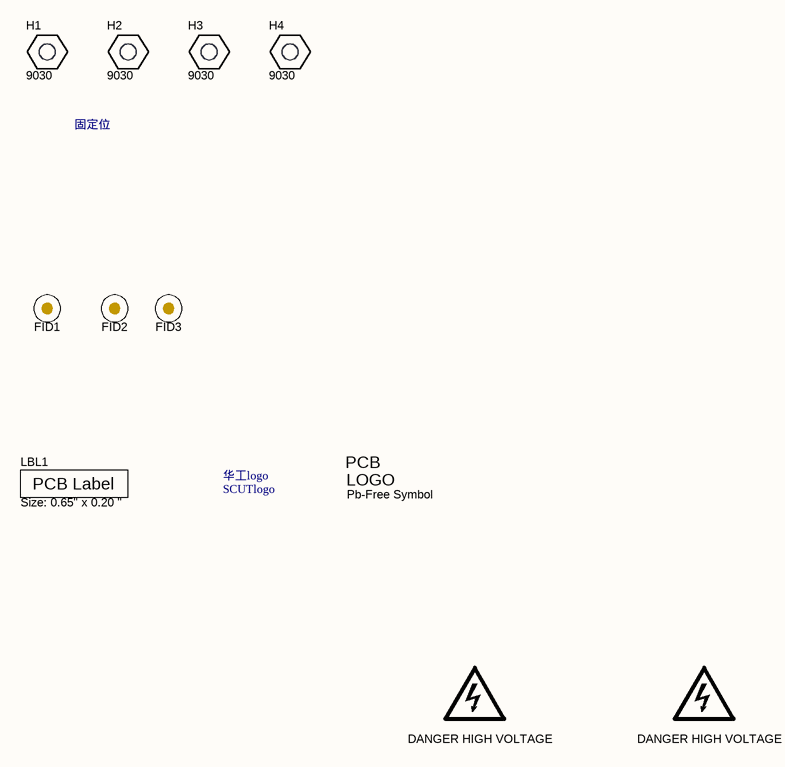
[diagram p3: Sheet_hardware.SchDoc]

### Parts
CAUTION_1  DANGER HIGH VOLTAGE  [IEC_HighVoltage_Small]  (no BOM)
CAUTION_2  DANGER HIGH VOLTAGE  [jingdian]  (no BOM)
FID1  Fiducial  [Fiducial10-20]  (value not drawn)
FID2  Fiducial  [Fiducial10-20]  (value not drawn)
FID3  Fiducial  [Fiducial10-20]  (value not drawn)
H1  9030  [Keystone_9030]
H2  9030  [Keystone_9030]
H3  9030  [Keystone_9030]
H4  9030  [Keystone_9030]
LBL1  Size: 0.65" x 0.20 "  [Label_650x200]
Logo2  Pb-Free Symbol  [Pb-Free_Overlay_Small]  (no BOM)
LOGO3  SCUTlogo  [SCUTlogo]

### Notes on the sheet
- 固定位
- (in symbol Pb-Free) PCB; LOGO
- (in symbol SCUTlogo) 华工logo
- (in symbol THT-14-423-10) PCB Label

### Library data of the parts
CAUTION_1 CAUTION_2 = IEC_HighVoltage: IEC 61010-1 High Voltage Warning; SymbolCreator: a0412235; SymbolVersion: 2011-08-22; Published: 2009-03-03; Publisher: Texas Instruments; LatestRevisionDate: 2014-11-20
FID1-FID3 = Fiducial: Fiducial mark.  There is nothing to buy or mount.; SymbolCreator: codlsc; SymbolVersion: 2009-11-4; CompType: Fiducial; Publisher: Texas Instruments; LatestRevisionDate: 2014-08-01; LatestRevisionNote: Added Alternate PartNumber and Alternate Manufacturer parameters to appropriate components.; Manufacturer: N/A; MountType: N/A; PackageReference: Fiducial; PartNumber: N/A; ClassName: FiducialMark
H1-H4 = 9030: BRD SPT SNAP LOCK SCREW MNT 3/8"; Manufacturer: Keystone; SymbolCreator: a0412235; CompType: Nylon Spacer; SymbolVersion: 2013-06-24; PartNumber: 9030; RoHS: Y; PackageReference: BRD SPT SNAP LOCK SCREW MNT 3/8"; MountType: TH; ComponentLink1Description: Datasheet Link; ComponentLink1URL: http://www.keyelco.com/userAssets/file/M60-2p77.pdf; Publisher: Texas Instruments; LatestRevisionDate: 2015-08-11; Supplier 1: Digi-Key; Supplier Part Number 1: 36-9030-ND; Supplier 2: Mouser; Supplier Part Number 2: 534-9030
LBL1 = THT-14-423-10: Thermal Transfer Printable Labels, 0.650" W x 0.200" H - 10,000 per roll; Manufacturer: Brady; SymbolCreator: a0412235; CompType: Label; SymbolVersion: 2012-06-12; ClassName: Label; PartNumber: THT-14-423-10; RoHS: Y; PackageReference: PCB Label 0.650"H x 0.200"W; MountType: N/A; ComponentLink1Description: Web Page; ComponentLink1URL: http://www.bradyid.com/bradyid/pdpv/THT-14-423-10.html; Note: Size: 0.65" x 0.20 "; Publisher: Texas Instruments; LatestRevisionDate: 2012-07-31; LatestRevisionNote: Initial Version; Alternate Manufacturer: -; Alternate PartNumber: -; Supplier 1: Farnell; Supplier Part Number 1: 2065596; Supplier 2: Newark; Supplier Part Number 2: 97C5133
Logo2 = Pb-Free: SymbolCreator: a0412235; SymbolVersion: 2011-08-22; Published: 2009-03-03; Publisher: Texas Instruments; LatestRevisionDate: 2014-08-05

## Nets that join several sheets
1-CELL0: Sheet1 (22 pins), Sheet2 (52 pins), Sheet5 (18 pins)
AGND: Sheet1 (P5.2 P5.10 P6.6), Sheet5 (33 pins)
1-ALERT: Sheet1 (P7.4), Sheet2 (U1.38), Sheet5 (R189.1)
1-ALERT_N: Sheet1 (C2.2 P4.1 R4.1), Sheet2 (C37.1 U1.57)
1-ALERT_S: Sheet1 (P8.1 R55.1 R55.2 R59.2), Sheet2 (U1.23)
1-CELL1: Sheet1 (JP17.1 P1.6 R52.2), Sheet2 (10 pins)
1-CELL2: Sheet1 (JP16.1 P1.5 R51.2), Sheet2 (10 pins)
1-CELL3: Sheet1 (JP15.1 P1.4 R50.2), Sheet2 (10 pins)
1-CELL4: Sheet1 (JP14.1 P1.3 R49.2), Sheet2 (10 pins)
1-CELL5: Sheet1 (JP13.1 P1.2 R48.2), Sheet2 (10 pins)
1-CELL6: Sheet1 (P1.1 R47.2 TP5.1), Sheet2 (6 pins)
1-CONV: Sheet1 (P7.1), Sheet2 (R83.1 U1.36), Sheet5 (R194.1)
1-CONV_N: Sheet1 (R1.1 R2.1), Sheet2 (U1.59)
1-CONV_S: Sheet1 (C10.1 P8.4 R57.2), Sheet2 (C6.1 U1.21)
1-CS_N: Sheet1 (R9.1 R12.1), Sheet2 (R105.2 U1.52)
1-CS_S: Sheet1 (C13.1 P8.8 R64.2), Sheet2 (C7.1 U1.29)
1-DRDY: Sheet1 (P7.6), Sheet2 (U1.37), Sheet5 (R196.1)
1-DRDY_N: Sheet1 (C1.2 P4.2 R3.1), Sheet2 (C38.1 U1.58)
1-DRDY_S: Sheet1 (P8.2 R54.1 R54.2 R58.2), Sheet2 (U1.22)
1-FAULT: Sheet1 (P7.3), Sheet2 (U1.39), Sheet5 (R188.1)
1-FAULT_N: Sheet1 (C3.2 P4.3 R5.1), Sheet2 (C36.1 U1.56)
1-FAULT_S: Sheet1 (P8.3 R56.1 R56.2 R60.2), Sheet2 (U1.24)
1-SCLK_N: Sheet1 (R6.1 R10.1), Sheet2 (R103.2 U1.55)
1-SCLK_S: Sheet1 (C11.1 P8.7 R61.2), Sheet2 (C9.1 U1.26)
1-SDI_N: Sheet1 (R8.1 R11.1), Sheet2 (R104.2 U1.53)
1-SDI_S: Sheet1 (C12.1 P8.10 R63.2), Sheet2 (C8.1 U1.28)
1-SDO_N: Sheet1 (C5.2 P4.9 R7.1), Sheet2 (C35.1 U1.54)
1-SDO_S: Sheet1 (P8.9 R62.2 R65.1 R65.2), Sheet2 (R13.1 U1.27)
1-SPI-MISO: Sheet1 (P7.5), Sheet2 (U1.41), Sheet5 (R206.2)
1-SPI-MOSI: Sheet1 (P7.8), Sheet2 (R82.1 U1.42), Sheet5 (R201.2)
1-SPI-SCLK: Sheet1 (P7.7), Sheet2 (R80.1 U1.40), Sheet5 (R203.2)
1-SPI-SS: Sheet1 (P7.9), Sheet2 (R73.1), Sheet5 (R197.2)
1-VBAT: Sheet1 (15 pins), Sheet2 (10 pins)
3.3_SW: Sheet1 (P6.1), Sheet5 (17 pins)
5V_USB: Sheet1 (P5.4 P5.6), Sheet5 (C125.1 JP19.3 R210.1)
ALERT: Sheet1 (P6.3), Sheet5 (U4.13 U5.11)
CONV: Sheet1 (P6.5), Sheet5 (R204.2 U4.11 U5.9)
CS: Sheet1 (P5.9 P6.9), Sheet5 (R198.1 R207.2 U6.3)
DRDY: Sheet1 (P6.4), Sheet5 (U4.12 U5.10)
FAULT: Sheet1 (P6.2), Sheet5 (U4.14 U5.12)
GPIO0/I2C(SDA): Sheet1 (P5.3), Sheet5 (R192.1 U5.2)
GPIO1/I2C(SCL): Sheet1 (P5.1), Sheet5 (R191.1 U5.1)
SCLK: Sheet1 (P5.7 P6.10), Sheet5 (R200.1 R209.2 U6.5)
SIMO: Sheet1 (P5.8 P6.7), Sheet5 (R199.1 R208.2 U6.4)
SOMI: Sheet1 (P5.5 P6.8), Sheet5 (R205.1)